# Altium schematic sheet 01_POWER_INPUT.SchDoc: Схема электрическая принципиальная
size 420 x 297 mm; Date: 26.10.2026; ApprovedBy: Скрябин; CheckedBy: Скрябин; Author: Корсунов; CompanyName: РТУ МИРЭА; DocumentNumber: RP23.000001.001 Э3; Revision: 1; SheetNumber: 1; SheetTotal: 11; PageSetup: Record=PageOptions|CenterHorizontal=True|CenterVertical=True|PrintScale=0.94|XCorrection=1.00|YCorrection=1.00|PrintKind=1|BorderSize=5000000|LeftOffset=0|BottomOffset=0|Orientation=1|PaperLength=1000|PaperWidth=1000|Scale=100|PaperSource=7|PrintQuality=-4|MediaType=1|DitherType=10|PaperKind=A4|PrintScaleMode=1; DecimalNumber: RP23.000001.001; Name1: Модуль ввода-вывода; lit_A: О; Name2: RP2350 OPC UA
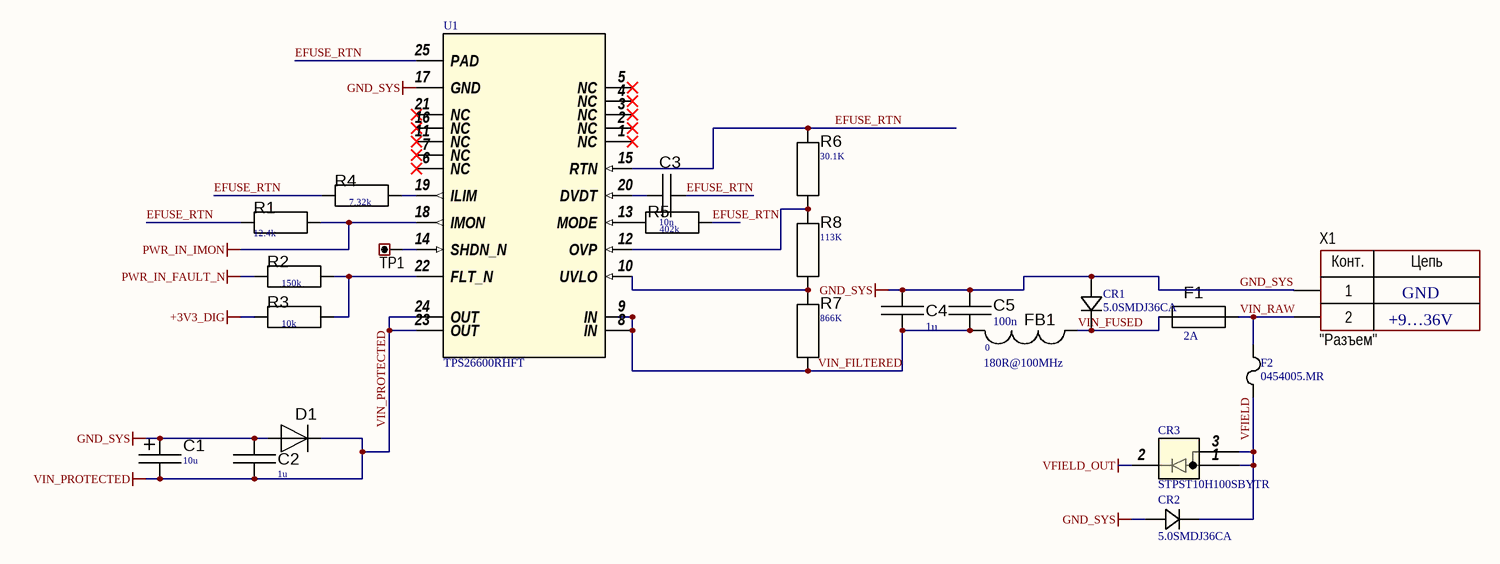
[diagram p0: 01_POWER_INPUT.SchDoc]

## Parts
C1  value 10u  [C_SMD_Al_D]  (hidden comment: Capacitor)
C2  value 1u  [C_1206]  (hidden comment: Capacitor)
C3  value 10n  [C_0603]  (hidden comment: Capacitor)
C4  value 1u  [C_1206]  (hidden comment: Capacitor)
C5  value 100n  [C_0805]  (hidden comment: Capacitor)
CR1  5.0SMDJ36CA  [5.0SMDJSeries_LTF]
CR2  5.0SMDJ36CA  [5.0SMDJSeries_LTF]
CR3  STPST10H100SBYTR  [DPAK_STM]
D1  Schottky Diode  [SMC]  (value not drawn)
F1  CURRENT: 2A  [0454Series_LTF]  (hidden comment: Fuse)
F2  0454005.MR  [0454Series_LTF]
FB1  180R@100MHz  value 0  [L_0805]
R1  value 12.4k  [R_0603]  (hidden comment: Resistor)
R2  value 150k  [R_0805]  (hidden comment: Resistor)
R3  value 10k  [R_0805]  (hidden comment: Resistor)
R4  value 7.32k  [R_0805]  (hidden comment: Resistor)
R5  value 402k  [R_0805]  (hidden comment: Resistor)
R6  value 30.1K  [R_0805]  (hidden comment: Resistor)
R7  value 866K  [R_0805]  (hidden comment: Resistor)
R8  value 113K  [R_0805]  (hidden comment: Resistor)
TP1  (no value)  [CON: 5000 (Keystone)]
U1  TPS26600RHFT  [RHF0024A]
X1  CommentText: "Разъем"  [CON: DG350-3.5-02P]

## Nets
+3V3_DIG: R3.1
GND_SYS: C1.2 C2.2 C4.2 C5.2 CR1.2 CR2.2 D1.1(A) U1.17(GND) X1.1
PWR_IN_FAULT_N: R2.1
PWR_IN_IMON: R1.2 U1.18(IMON)
VFIELD_OUT: CR3.2(CATHODE)
VIN_PROTECTED: C1.1 C2.1 D1.2(C) U1.23(OUT) U1.24(OUT)
EFUSE_RTN: C3.1 R1.1 R4.1 R5.2 R6.2 U1.15(RTN) U1.25(PAD)
VFIELD: CR2.1 CR3.1(ANODE) CR3.3(ANODE) F2.1
VIN_FILTERED: C4.1 C5.1 FB1.2 R7.1 U1.8(IN) U1.9(IN)
VIN_FUSED: CR1.1 F1.1 FB1.1
VIN_RAW: F1.2 F2.2 X1.2
NetC3_2: C3.2 U1.20(DVDT)
NetR2_2: R2.2 R3.2 U1.22(FLT_N)
NetR4_2: R4.2 U1.19(ILIM)
NetR5_1: R5.1 U1.13(MODE)
NetR6_1: R6.1 R8.2 U1.12(OVP)
NetR7_2: R7.2 R8.1 U1.10(UVLO)
NetTP1_1: TP1.1 U1.14(SHDN_N)

Not connected (* = marked no-connect by the designer): U1 1(NC)* 2(NC)* 3(NC)* 4(NC)* 5(NC)* 6(NC)* 7(NC)* 11(NC)* 16(NC)* 21(NC)*

## Notes on the sheet
- GND
- +9…36V
- Перв.примен.
- Справ.№
- Подп. и дата
- Инв.№ дубл.
- Взам.инв.№
- Подп.и дата
- Разраб.
- Изм.
- Лист
- № докум.
- Подп.
- Дата
- Лит.
- Масштаб
- Масса
- Т.контр.
- Пров.
- СХЕМА   ЭЛЕКТРИЧЕСКАЯ
- ПРИНЦИПИАЛЬНАЯ
- Листов
- Инв.№ подл.
- Утв.
- Н.контр.
- Нач.сект.
- Формат  A3
- (in symbol Connector_terminal_2pin) Конт.; Цепь

## Library data of the parts
C1-C5 = Capacitor: SimulationGenericComponent: True
CR1 CR2 = 5.0SMDJ36CA: No Description Available; Manufacturer_Name: Littelfuse Inc; Copyright: Copyright (C) 2026 Ultra Librarian. All rights reserved.; Manufacturer_Part_Number: 5.0SMDJ36CA
CR3 = STPST10H100SBYTR: Automotive 100 V, 10 A, DPAK Power Schottky Trench Rectifier; Manufacturer_Name: STMicroelectronics; Copyright: Copyright (C) 2026 Ultra Librarian. All rights reserved.; Manufacturer_Part_Number: STPST10H100SBYTR; Datasheet: https://www.st.com/resource/en/datasheet/stpst10h100sb-y.pdf; RefDes: RefDes; Type: Type
D1 = Schottky Diode: AF: 1; BV: 0; BV_MAX: 1e99; EG: 1.11; FC: 0.5; IBV: 0.001; IS: 1e-14; MJSW: 0.33; NTUN: 30; TNOM: 27; XTI: 3; SimulationGenericComponent: True; CJO: 0; CJP: 0; CTA: 0; CTP: 0; FCS: 0.5; FV_MAX: 1e99; IKF: 0; IKR: 0; ISR: 1e-14; JSW: 0; JTUN: 0; JTUNSW: 0; KEG: 1; KF: 0; LEVEL: 1; N: 1; NBV: 1; NR: 1; NS: 1; PHP: 1; RS: 0; TCV: 0; TLEV: 0; TLEVC: 0; TM1: 0; TM2: 0; TPB: 0; TPHP: 0; TRS: 0; TRS2: 0; TT: 0; TTT1: 0; TTT2: 0; VJ: 1; XTITUN: 3
F1 = Fuse: RESISTANCE: 1m; SimulationGenericComponent: True
F2 = 0454005.MR: No Description Available; Manufacturer_Name: Littelfuse Inc; Copyright: Copyright (C) 2026 Ultra Librarian. All rights reserved.; Manufacturer_Part_Number: 0454005.MR
FB1 = Resistor: SimulationGenericComponent: True; TC1: 0; TC2: 0
R1-R8 = Resistor: TC1: 0; SimulationGenericComponent: True; TC2: 0
TP1 = Connector_Test_Point: Manufacturer: Keystone; ValueManufacturerPartNumber: Test point, Keystone, 5001; PartNumber: 5001; TypeConnector: Test point; HelpURL: https://www.digikey.com/product-detail/en/keystone-electronics/5001/36-5001-ND/255327
U1 = TPS26600RHFT: 4.2-V to 60-V, 150m&Omega;, 0.1-2.23A eFuse with integrated input reverse polarity protection 24-VQFN -40 to 125; Manufacturer_Name: Texas Instruments; TYPE: TYPE; RefDes: RefDes; Copyright: Copyright (C) 2026 Ultra Librarian. All rights reserved.; Manufacturer_Part_Number: TPS26600RHFT; Datasheet: https://www.ti.com/lit/gpn/tps2660
X1 = Connector_terminal_2pin: Manufacturer: Degson; ValueManufacturerPartNumber: Terminal connector, 2pin, 3.5mm, 300VAC, 10A; PartNumber: DG350-3.5-02P-14; TypeConnector: Terminal connector; VoltageMax: 300VAC; Pitch: 3.5mm; CurrentMax: 10A; Multichannel: 2pin; HelpURL: https://www.chipdip.ru/product/dg350-3.5-02p-12